# Altium project V3_Board.PrjPcb (part 2 of 9)

## Sheet Regulator_Section.SchDoc
size A4; DocumentNumber: 6; SheetNumber: 6; SheetTotal: 17
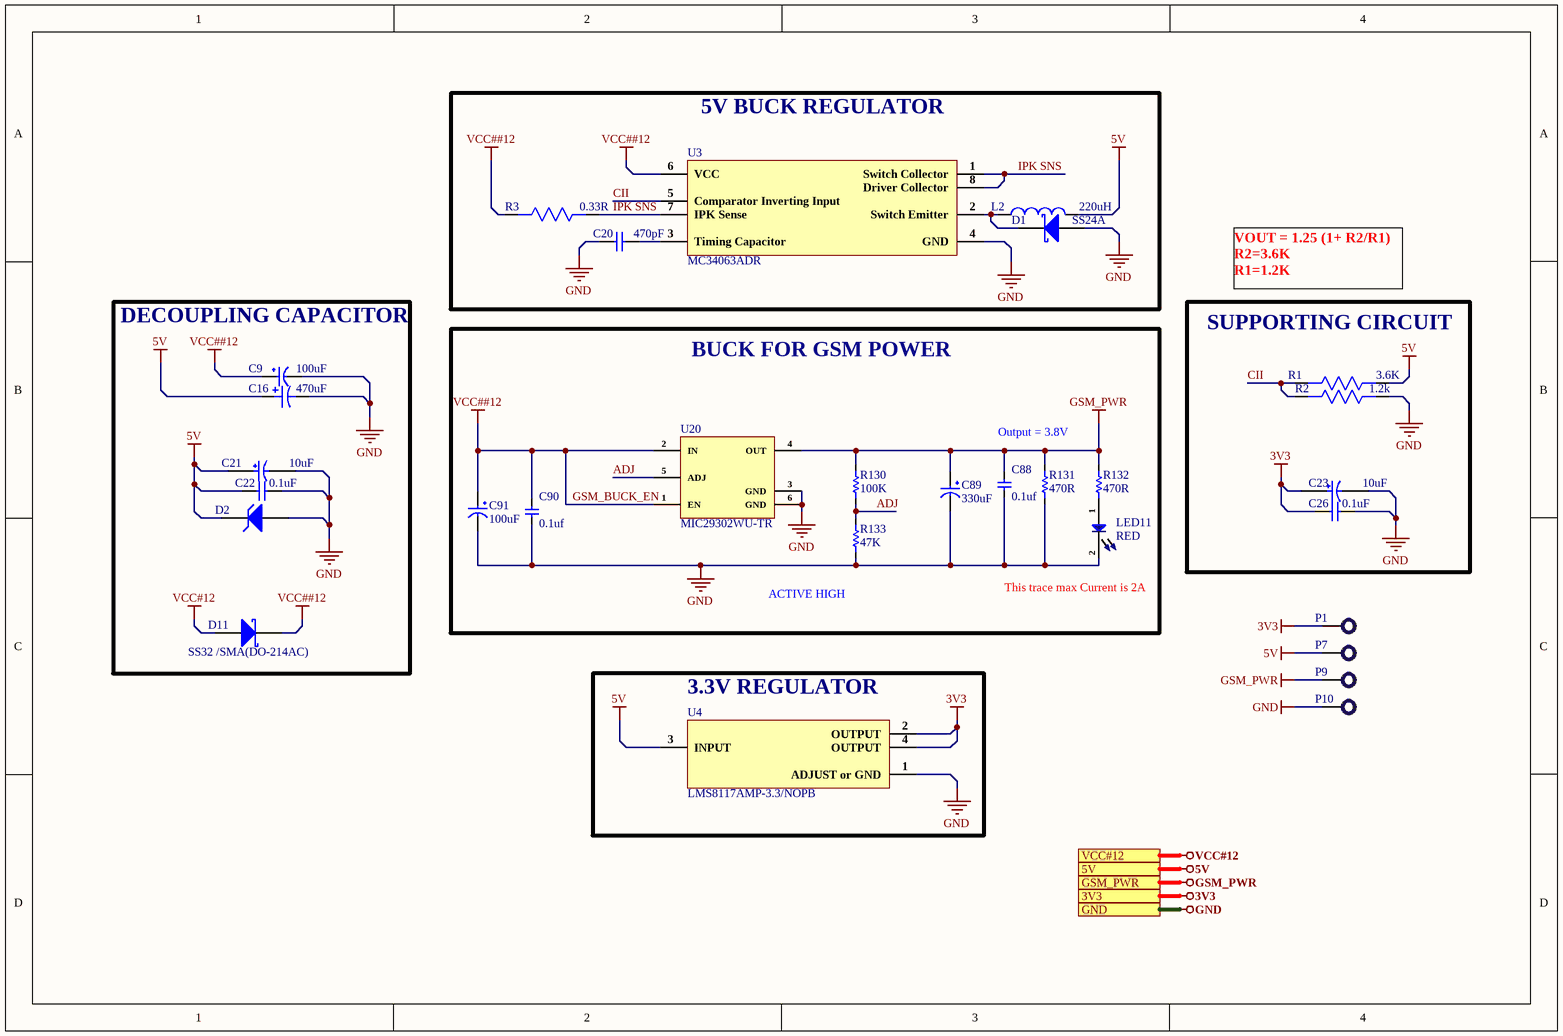
[diagram p4: Regulator_Section.SchDoc]

### Parts
C9  100uF  [UWX1E101MCL1GB]
C16  470uF  [VT1H471MI135000CE0]
C20  470pF  [Cap0603]
C21  10uF  [RVT1E100M0405.]
C22  0.1uF  [Cap0603]
C23  10uF  [RVT1E100M0405.]
C26  0.1uF  [Cap0603]
C88  0.1uf  [Cap-0402]
C89  330uF  [Case-E]
C90  0.1uf  [Cap-0402]
C91  100uF  [Case-B]
D1  SS24A  [SMA]
D2  1SMA5930BT3G  [SMA]  (value not drawn)
D11  SS32 /SMA(DO-214AC)  [SMA]
L2  220uH  [SLF12575T-221M1R3-PF]
LED11  RED  [LED-0603]
P1  Test Point  [TEST POINT]  (value not drawn)
P7  Test Point  [TEST POINT]  (value not drawn)
P9  Test Point  [TEST POINT]  (value not drawn)
P10  Test Point  [TEST POINT]  (value not drawn)
R1  3.6K  [RES-0603]
R2  1.2k  [RES-0603]
R3  0.33R  [RES-0603]
R130  100K  [Res-0201]
R131  470R  [Res-0201]
R132  470R  [Res-0201]
R133  47K  [Res-0402]
U3  MC34063ADR  [SOIC-8]
U4  LMS8117AMP-3.3/NOPB  [SOT-223]
U20  MIC29302WU-TR  [TO-263-5 (D2PAK)]

### Blocks framed on the sheet
5V BUCK REGULATOR: C20 D1 L2 R3 U3
DECOUPLING CAPACITOR: C9 C16 C21 C22 D2 D11
SUPPORTING CIRCUIT: C23 C26 R1 R2
BUCK FOR GSM POWER: C88-C91 LED11 R130-R133 U20
3.3V REGULATOR: U4

### Ports
3V3, 5V, GND, GSM_PWR, VCC#12

### Nets
3V3: C23.1 C26.1 P1.1 U4.2(OUTPUT) U4.4(OUTPUT) ; port 3V3
5V: C16.1 C21.1 C22.1 D2.1(K) L2.2 P7.1 R1.1 U4.3(INPUT) ; port 5V
GND: C9.2 C16.2 C20.1 C21.2 C22.2 C23.2 C26.2 C88.1 C89.2 C90.1 C91.2 D1.2(A) D2.2(A) LED11.2 P10.1 R2.1 R131.1 R133.1 U3.4(GND) U4.1(ADJUST_or_GND) U20.3(GND) U20.6(GND) ; port GND
GSM_BUCK_EN: C9.1 C90.2 C91.1 D11.1(K) R3.2 U3.6(VCC) U20.1(EN) U20.2(IN)  [also labelled VCC##12]
GSM_PWR: C88.2 C89.1 P9.1 R130.2 R131.2 R132.2 U20.4(OUT) ; port GSM_PWR
VCC#12: D11.2(A) ; port VCC#12
ADJ: R130.1 R133.2 U20.5(ADJ)
CII: R1.2 R2.2 U3.5(Comparator_Inverting_Input)
IPK SNS: R3.1 U3.1(Switch_Collector) U3.7(IPK_Sense) U3.8(Driver_Collector)
NetC20_2: C20.2 U3.3(Timing_Capacitor)
NetD1_1: D1.1(K) L2.1 U3.2(Switch_Emitter)
NetLED11_1: LED11.1 R132.1

### Notes on the sheet
- VOUT = 1.25 (1+ R2/R1)
  R2=3.6K
  R1=1.2K
- Output = 3.8V
- (near R133) ACTIVE HIGH
- (near LED11) This trace max Current is 2A

### Library data of the parts
C9 = UWX1E101MCL1GB: CAP ALUM 100UF 20% 25V SMD; Manufacturer: Nichicon; Dielectric Material: Aluminium; Ripple Current: 110mA; Polarity: Polar; Leakage Current: 3uA; Life (Hours): 2000Hour; Dissipation Factor: 0.14%; Lead Diameter: 0.8mm; Supplier 1: Digi-Key; Manufacturer Part Number: UWX1E101MCL1GB; Stock 1: 30613; Pricing 1: 1=0.43, 10=0.301, 50=0.211, 100=0.1808, 500=0.13558 (USD); Mount: Surface Mount; Case/Package: Radial; Number of Pins: 2; Weight: 0.01lb; Min Operating Temperature: -40°C; Max Operating Temperature: 85°C; Capacitance: 100uF; Tolerance: 20%; Ripple Current (AC): 110mA; Voltage Rating: 25V; Packaging: Tape and Reel; Package Quantity: 1000; Voltage Rating (DC): 25V; Termination: SMD/SMT; Voltage: 25V; Series: WX; Construction: Cylindrical; Diameter: 8mm; Length: 5.4mm; Width: 0.25inch; Height: 5.4mm; Lead Pitch: 2.3mm; Height - Seated (Max): 0.213inch; Radiation Hardening: No; REACH SVHC: No SVHC; Lead Free: Lead Free; RoHS Compliant: Yes; ComponentLink1URL: http://nichicon-us.com/english/products/pdfs/e-uwx.pdf?src-supplier=Digi-Key; ComponentLink1Description: http://nichicon-us.com/english/products/pdfs/e-uwx.pdf?src-supplier=Digi-Key; ComponentLink2URL: http://www.nichicon.co.jp/english/products/pdfs/e-ch_ref.pdf?src-supplier=Mouser; ComponentLink2Description: http://www.nichicon.co.jp/english/products/pdfs/e-ch_ref.pdf?src-supplier=Mouser; ComponentLink3URL: http://www.nichicon.co.jp/english/products/pdfs/e-wx.pdf?src-supplier=Avnet; ComponentLink3Description: http://www.nichicon.co.jp/english/products/pdfs/e-wx.pdf?src-supplier=Avnet; ComponentLink4URL: http://uk.rs-online.com/webdocs/0fa3/0900766b80fa3a90.pdf?src-supplier=RSComponents; ComponentLink4Description: http://uk.rs-online.com/webdocs/0fa3/0900766b80fa3a90.pdf?src-supplier=RSComponents; ComponentLink5URL: http://nichicon-us.com/english/products/pdfs/e-wx.pdf?src-supplier=Future+Electronics; ComponentLink5Description: http://nichicon-us.com/english/products/pdfs/e-wx.pdf?src-supplier=Future+Electronics; ComponentLink6URL: http://www.nichicon.co.jp/english/products/pdfs/e-ch_ref.pdf?src-supplier=Avnet+Europe; ComponentLink6Description: http://www.nichicon.co.jp/english/products/pdfs/e-ch_ref.pdf?src-supplier=Avnet+Europe; ComponentLink7URL: http://www.farnell.com/datasheets/2364658.pdf?src-supplier=Element14; ComponentLink7Description: http://www.farnell.com/datasheets/2364658.pdf?src-supplier=Element14; Supplier Part Number 1: 493-2113-6-ND; Supplier 2: Digi-Key; RoHS: Yes; Category: Aluminum Electrolytic Capacitors; Stock 2: 25010; Pricing 2: 1=0.43000, 10=0.30100, 50=0.21100, 100=0.18080, 500=0.13558 (USD); ComponentLink8URL: https://datasheet.ciiva.com/11778/0900766b80fa3a90-11778418.pdf?src-supplier=RSComponents; ComponentLink8Description: https://datasheet.ciiva.com/11778/0900766b80fa3a90-11778418.pdf?src-supplier=RSComponents; ComponentLink9URL: https://datasheet.ciiva.com/17527/e-wx-17527624.pdf?src-supplier=Avnet+Europe; ComponentLink9Description: https://datasheet.ciiva.com/17527/e-wx-17527624.pdf?src-supplier=Avnet+Europe; ComponentLink10URL: https://datasheet.ciiva.com/5361/e-wx-11809-5361100.pdf?src-supplier=Mouser; ComponentLink10Description: https://datasheet.ciiva.com/5361/e-wx-11809-5361100.pdf?src-supplier=Mouser; ComponentLink11URL: https://datasheet.ciiva.com/28458/1912851-28458684.pdf?src-supplier=Element14; ComponentLink11Description: https://datasheet.ciiva.com/28458/1912851-28458684.pdf?src-supplier=Element14; ComponentLink12URL: https://datasheet.ciiva.com/96/e-wx-96650.pdf?src-supplier=Digi-Key; ComponentLink12Description: https://datasheet.ciiva.com/96/e-wx-96650.pdf?src-supplier=Digi-Key; ComponentLink13URL: https://datasheet.ciiva.com/96/e-wx-96651.pdf?src-supplier=Digi-Key; ComponentLink13Description: https://datasheet.ciiva.com/96/e-wx-96651.pdf?src-supplier=Digi-Key; ComponentLink14URL: https://datasheet.ciiva.com/96/e-wx-96652.pdf?src-supplier=Digi-Key; ComponentLink14Description: https://datasheet.ciiva.com/96/e-wx-96652.pdf?src-supplier=Digi-Key; ComponentLink15URL: https://datasheet.ciiva.com/11687/e-wx-11687148.pdf?src-supplier=Avnet; ComponentLink15Description: https://datasheet.ciiva.com/11687/e-wx-11687148.pdf?src-supplier=Avnet; ComponentLink16URL: https://datasheet.ciiva.com/16512/e-wx-16512638.pdf?src-supplier=Future+Electronics; ComponentLink16Description: https://datasheet.ciiva.com/16512/e-wx-16512638.pdf?src-supplier=Future+Electronics; Supplier Part Number 2: 493-2113-1-ND
C16 = VT1H471MI135000CE0: 470uF ±20% 50V 12.5mm 13.5mm 1000hrs 105℃ -40℃~+105℃ SMD,12.5x13.5mm Aluminum Electrolytic Capacitors - SMD RoHS; Manufacturer: Changzhou Huawei Elec; Package: SMD,12.5x13.5mm; Capacitance: 470uF; Tolerance: ±20%; Rated Voltage: 50V; φD: 12.5mm; L: 13.5mm; Lifetime @ Temp: 1000hrs 105℃; Operating Temperature: -40℃~+105℃
C20 = CC0603KRX7R9BB471: CAP CER 470pF 10% X7R 50V 0603 SMD; Manufacturer: Yageo; Dielectric Material: Ceramic; Insulation Resistance: 10GR; Dissipation Factor: 2.5%; Supplier 1: Digi-Key; Manufacturer Part Number: CC0603KRX7R9BB471; RoHS: Yes; Category: Ceramic Capacitors; Stock 1: 2173; Pricing 1: 1=0.10000, 10=0.04500, 50=0.02460, 100=0.02010, 500=0.01432, 1000=0.01125 (USD); Mount: Surface Mount; Case/Package: 0603; Number of Pins: 2; Case Code (Imperial): 0603; Case Code (Metric): 1608; Min Operating Temperature: -55°C; Max Operating Temperature: 125°C; Capacitance: 470pF; Tolerance: 10%; Dielectric: X7R; Series: CC; Voltage Rating: 50V; Voltage Rating (DC): 50V; Packaging: Tape and Reel; Package Quantity: 1; Termination: SMD/SMT; Resistor Type: Ceramic; Length: 1.6mm; Width: 0.8mm; Height: 0.8mm; Depth: 0.8mm; Thickness: 0.035inch; Radiation Hardening: No; RoHS Compliant: Yes; REACH SVHC: No SVHC; Lead Free: Lead Free; Halogen Free: Halogen Free; ComponentLink1URL: https://datasheet.ciiva.com/5425/upy-gphc-x7r-6-3v-to-50v-8-12304-5425461.pdf?src-supplier=Mouser; ComponentLink1Description: https://datasheet.ciiva.com/5425/upy-gphc-x7r-6-3v-to-50v-8-12304-5425461.pdf?src-supplier=Mouser; ComponentLink2URL: https://datasheet.ciiva.com/144/mlccorderingcode-144439.pdf?src-supplier=Digi-Key; ComponentLink2Description: https://datasheet.ciiva.com/144/mlccorderingcode-144439.pdf?src-supplier=Digi-Key; ComponentLink3URL: https://datasheet.ciiva.com/144/mlccorderingcode-144440.pdf?src-supplier=Digi-Key; ComponentLink3Description: https://datasheet.ciiva.com/144/mlccorderingcode-144440.pdf?src-supplier=Digi-Key; ComponentLink4URL: https://datasheet.ciiva.com/11587/upy-gphc-x7r-6-3v-to-50v-8-11587224.pdf?src-supplier=Avnet; ComponentLink4Description: https://datasheet.ciiva.com/11587/upy-gphc-x7r-6-3v-to-50v-8-11587224.pdf?src-supplier=Avnet; ComponentLink5URL: https://datasheet.ciiva.com/144/mlccorderingcode-144441.pdf?src-supplier=Digi-Key; ComponentLink5Description: https://datasheet.ciiva.com/144/mlccorderingcode-144441.pdf?src-supplier=Digi-Key; ComponentLink6URL: https://datasheet.ciiva.com/16623/upy-gphc-x7r-6-3v-to-50v-8-16623897.pdf?src-supplier=Avnet+Europe; ComponentLink6Description: https://datasheet.ciiva.com/16623/upy-gphc-x7r-6-3v-to-50v-8-16623897.pdf?src-supplier=Avnet+Europe; ComponentLink7URL: https://datasheet.ciiva.com/8033/1489800-8033898.pdf?src-supplier=Element14; ComponentLink7Description: https://datasheet.ciiva.com/8033/1489800-8033898.pdf?src-supplier=Element14; ComponentLink8URL: https://datasheet.ciiva.com/8033/1489800-8033899.pdf?src-supplier=Element14; ComponentLink8Description: https://datasheet.ciiva.com/8033/1489800-8033899.pdf?src-supplier=Element14; ComponentLink9URL: https://datasheet.ciiva.com/26829/getdatasheetpartid-251791-26829452.pdf?src-supplier=Verical; ComponentLink9Description: https://datasheet.ciiva.com/26829/getdatasheetpartid-251791-26829452.pdf?src-supplier=Verical; ComponentLink10URL: https://datasheet.ciiva.com/28450/1489800-28450652.pdf?src-supplier=Element14; ComponentLink10Description: https://datasheet.ciiva.com/28450/1489800-28450652.pdf?src-supplier=Element14; ComponentLink11URL: https://datasheet.ciiva.com/8033/70765-8033902.pdf?src-supplier=Element14; ComponentLink11Description: https://datasheet.ciiva.com/8033/70765-8033902.pdf?src-supplier=Element14; Supplier Part Number 1: 311-1078-1-ND
C21 C23 = RVT1E100M0405: CAP ALUM 10uF 25V SMD; Manufacturer: ROQANG; φD: 4mm; L: 5.4mm; Tolerance: ±20%; Operating Temperature: -45℃~+105℃; Rated Voltage: 25V; Capacitance: 10uF
C22 C26 = CC0603ZRY5V9BB104: CAP CER 0.1UF 50V Y5V 0603; Manufacturer: Yageo; Capacitance: 100nF; Tolerance: 80%; Supplier 1: Digi-Key; Manufacturer Part Number: CC0603ZRY5V9BB104; Stock 1: 15000880; Pricing 1: 1=0.1, 10=0.075, 100=0.0334, 500=0.02386, 1000=0.01874 (USD); Mount: Surface Mount; Case/Package: 0603; Number of Pins: 2; Case Code (Metric): 1608; Case Code (Imperial): 0603; Min Operating Temperature: -30°C; Max Operating Temperature: 85°C; Dielectric: Y5V; Voltage Rating: 50V; Package Quantity: 1; Packaging: Tape and Reel; Voltage Rating (DC): 50V; Termination: SMD/SMT; Composition: Ceramic; Voltage: 50V; Length: 1.6mm; Height: 0.8mm; Width: 0.031inch; Thickness: 0.035inch; Depth: 0.8mm; Radiation Hardening: No; REACH SVHC: No SVHC; Lead Free: Lead Free; Halogen Free: Halogen Free; ComponentLink1URL: http://www.yageo.com/documents/recent/UPY-GPHC_Y5V_6.3V-to-50V_8.pdf?src-supplier=Digi-Key; ComponentLink1Description: http://www.yageo.com/documents/recent/UPY-GPHC_Y5V_6.3V-to-50V_8.pdf?src-supplier=Digi-Key; ComponentLink2URL: http://www.yageo.com/documents/recent/UPY-GPHC_Y5V_6.3V-to-50V_5.pdf?src-supplier=Avnet+Europe; ComponentLink2Description: http://www.yageo.com/documents/recent/UPY-GPHC_Y5V_6.3V-to-50V_5.pdf?src-supplier=Avnet+Europe; ComponentLink3URL: https://www.verical.com/server-webapp/html/getDatasheet?partID=403611&src-supplier=Verical; ComponentLink3Description: https://www.verical.com/server-webapp/html/getDatasheet?partID=403611&src-supplier=Verical; ComponentLink4URL: http://www.mouser.com/ds/2/447/Yageo_UPY-GP_NP0_16V-to-50V_9-358835.pdf?src-supplier=Mouser; ComponentLink4Description: http://www.mouser.com/ds/2/447/Yageo_UPY-GP_NP0_16V-to-50V_9-358835.pdf?src-supplier=Mouser; ComponentLink5URL: http://www.farnell.com/datasheets/1132289.pdf?src-supplier=Element14; ComponentLink5Description: http://www.farnell.com/datasheets/1132289.pdf?src-supplier=Element14; Supplier Part Number 1: 311-1343-1-ND
C88 C90 = GRM155R62A104KE14D: CAP CER 0.1UF 100V X5R 0402; Manufacturer: Murata; Capacitance: 100nF; Tolerance: 10%; Item Type: Capacitor; Supplier 1: Arrow Electronics; Manufacturer Part Number: GRM155R62A104KE14D; RoHS: Yes; Category: Ceramic Capacitors; Stock 1: 870000; Pricing 1: 10000=0.00500, 20000=0.00410, 30000=0.00390, 50000=0.00370, 100000=0.00300 (USD); Mount: Surface Mount; Case/Package: 0402; Case Code (Metric): 1005; Case Code (Imperial): 0402; Weight: 0.000212oz; Min Operating Temperature: -55°C; Max Operating Temperature: 85°C; Packaging: Tape and Reel; Voltage Rating: 100V; Dielectric: X5R; Termination: SMD/SMT; Voltage Rating (DC): 100V; Package Quantity: 10000; Series: GRM; Length: 0.039inch; Width: 0.02inch; Height: 0.5mm; Thickness: 0.022inch; Reach SVHC Compliant: Yes; Lead Free: Lead Free; RoHS Compliant: Yes; ComponentLink1URL: http://www.farnell.com/datasheets/2079151.pdf?src-supplier=Farnell; ComponentLink1Description: http://www.farnell.com/datasheets/2079151.pdf?src-supplier=Farnell; ComponentLink2URL: http://www.mouser.com/ds/2/281/c02e-2905.pdf?src-supplier=Mouser; ComponentLink2Description: http://www.mouser.com/ds/2/281/c02e-2905.pdf?src-supplier=Mouser; ComponentLink3URL: http://www.farnell.com/datasheets/2079151.pdf?src-supplier=Element14; ComponentLink3Description: http://www.farnell.com/datasheets/2079151.pdf?src-supplier=Element14; ComponentLink4URL: http://search.murata.co.jp/Ceramy/image/img/A01X/G101/ENG/GRM155R62A104KE14-01.pdf?src-supplier=Digi-Key; ComponentLink4Description: http://search.murata.co.jp/Ceramy/image/img/A01X/G101/ENG/GRM155R62A104KE14-01.pdf?src-supplier=Digi-Key; ComponentLink5URL: http://www.farnell.com/datasheets/2079151.pdf?src-supplier=Newark; ComponentLink5Description: http://www.farnell.com/datasheets/2079151.pdf?src-supplier=Newark; Supplier Part Number 1: GRM155R62A104KE14D; LCSC Part Number: C162178
C89 = TAJE337M016RNJ: CAP TANT 330UF 20% 16V 2917; Manufacturer: Kyocera AVX; ESR (Equivalent Series Resistance): 400mR; Leakage Current: 52.8uA; Dissipation Factor: 30%; Item Type: Capacitor; Supplier 1: Arrow Electronics; Manufacturer Part Number: TAJE337M016RNJ; RoHS: Yes; Category: Tantalum Capacitors; Stock 1: 4000; Pricing 1: 400=1.8678, 2000=1.7998, 4000=1.7657, 6000=1.7481, 10000=1.7306, 30000=1.7133, 50000=1.6961 (USD); Mounting Technology: Surface Mount; Case/Package: 2917; Case Code (Imperial): 2917; Case Code (Metric): 7343; Min Operating Temperature: -55°C; Max Operating Temperature: 125°C; Voltage Rating: 16V; Tolerance: 20%; Packaging: Tape and Reel; Value: 330uF; Termination: SMD/SMT; Voltage Rating (DC): 16V; Series: TAJ; Features: General Purpose; Length: 7.3mm; Width: 4.3mm; Height: 4.3mm; Lead Free: Lead Free; RoHS Compliant: Yes; ComponentLink1URL: https://datasheet.ciiva.com/12882/taj-27497-12882412.pdf?src-supplier=Mouser; ComponentLink1Description: https://datasheet.ciiva.com/12882/taj-27497-12882412.pdf?src-supplier=Mouser; Supplier Part Number 1: TAJE337M016RNJ; LCSC Part Number: C51599
C91 = TAJB107M010RNJ: CAP TANT 100UF 20% 10V 1411; Manufacturer: Kyocera AVX; Dielectric Material: Tantalum; Tolerance: 10%; ESR (Equivalent Series Resistance): 1.4R; Leakage Current: 10uA; Dissipation Factor: 8%; Item Type: Capacitor; Supplier 1: Rs; Manufacturer Part Number: TAJB107M010RNJ; RoHS: Yes; Category: Tantalum Capacitors; Stock 1: 17520; Pricing 1: 2000=0.302 (GBP); Mounting Technology: Surface Mount; Case/Package: 1210; Case Code (Imperial): 1210; Case Code (Metric): 3528; Min Operating Temperature: -55°C; Max Operating Temperature: 125°C; Value: 100uF; Voltage Rating (DC): 10V; Series: TAJ; Construction: Flat; Voltage Rating: 10V; Package Quantity: 2000; Packaging: Tape and Reel; Termination: SMD/SMT; Voltage: 10V; Features: General Purpose; Length: 3.5mm; Width: 2.8mm; Height: 2.1mm; Depth: 2.8mm; Radiation Hardening: No; Lead Free: Lead Free; RoHS Compliant: Yes; Reach SVHC Compliant: No; ComponentLink1URL: https://datasheet.ciiva.com/264/taj-264281.pdf?src-supplier=Digi-Key; ComponentLink1Description: https://datasheet.ciiva.com/264/taj-264281.pdf?src-supplier=Digi-Key; ComponentLink2URL: https://datasheet.ciiva.com/264/taj-264280.pdf?src-supplier=Digi-Key; ComponentLink2Description: https://datasheet.ciiva.com/264/taj-264280.pdf?src-supplier=Digi-Key; ComponentLink3URL: https://datasheet.ciiva.com/264/taj-264282.pdf?src-supplier=Digi-Key; ComponentLink3Description: https://datasheet.ciiva.com/264/taj-264282.pdf?src-supplier=Digi-Key; ComponentLink4URL: https://datasheet.ciiva.com/11225/taj-11225964.pdf?src-supplier=Avnet; ComponentLink4Description: https://datasheet.ciiva.com/11225/taj-11225964.pdf?src-supplier=Avnet; ComponentLink5URL: https://datasheet.ciiva.com/11225/taj-11225963.pdf?src-supplier=Avnet; ComponentLink5Description: https://datasheet.ciiva.com/11225/taj-11225963.pdf?src-supplier=Avnet; Supplier Part Number 1: 1354069; LCSC Part Number: C7196
D1 = SS24A: 40V 500mV@2A 2A SMA(DO-214AC) Schottky Barrier Diodes (SBD) ROHS; Manufacturer: Yangzhou; Manufacturer Part Number: SS24A; Footprint: SMA(DO-214AC); ComponentLink1Description: LCSC; ComponentLink1URL: https://lcsc.com/product-detail/Schottky-Barrier-Diodes-SBD_Yangzhou-Yangjie-Elec-Tech-SS24A_C211773.html
D2 = 1SMA5930BT3G: DIODE ZENER 16V 1.5W SMA; Manufacturer: ON Semiconductor; Tolerance: 5%; Max Reverse Leakage Current: 500nA; Impedance: 10R; Element Configuration: Single; Forward Voltage: 1.5V; Power Dissipation: 500mW; Zener Current: 94mA; Test Current: 23.4mA; ESD Protection: Yes; Supplier 1: Avnet; Manufacturer Part Number: 1SMA5930BT3G; RoHS: Yes; Category: Zener Diodes; Stock 1: 52; Pricing 1: 5000=0.16900 (USD); Case/Package: SMA; Number of Pins: 2; Contact Plating: Tin,Matte; Min Operating Temperature: -65°C; Max Operating Temperature: 150°C; Packaging: Tape and Reel; Package Quantity: 1; Max Power Dissipation: 1.5W; Voltage Tolerance: 5%; Zener Voltage: 16V; Working Voltage: 16V; Max Reverse Current: 500nA; Power Rating: 1.5W; Voltage Rating (DC): 16V; Length: 4.57mm; Width: 2.92mm; Height: 2.05mm; Radiation Hardening: No; Lead Free: Lead Free; Halogen Free: Halogen Free; RoHS Compliant: Yes; REACH SVHC: No SVHC; ComponentLink1URL: https://datasheet.ciiva.com/15142/getdatasheetpartid-39534-15142033.pdf?src-supplier=Verical; ComponentLink1Description: https://datasheet.ciiva.com/15142/getdatasheetpartid-39534-15142033.pdf?src-supplier=Verical; ComponentLink2URL: https://datasheet.ciiva.com/30478/0900766b8127698c-30478429.pdf?src-supplier=RSComponents; ComponentLink2Description: https://datasheet.ciiva.com/30478/0900766b8127698c-30478429.pdf?src-supplier=RSComponents; ComponentLink3URL: https://datasheet.ciiva.com/8026/1sma5913bt3-d-8026927.pdf?src-supplier=Element14; ComponentLink3Description: https://datasheet.ciiva.com/8026/1sma5913bt3-d-8026927.pdf?src-supplier=Element14; ComponentLink4URL: https://datasheet.ciiva.com/26092/1sma5913bt3-d-26092437.pdf?src-supplier=Avnet+Europe; ComponentLink4Description: https://datasheet.ciiva.com/26092/1sma5913bt3-d-26092437.pdf?src-supplier=Avnet+Europe; ComponentLink5URL: https://datasheet.ciiva.com/895/1sma5913bt3-d-895337.pdf?src-supplier=Digi-Key; ComponentLink5Description: https://datasheet.ciiva.com/895/1sma5913bt3-d-895337.pdf?src-supplier=Digi-Key; ComponentLink6URL: https://datasheet.ciiva.com/895/1sma5913bt3-d-895338.pdf?src-supplier=Digi-Key; ComponentLink6Description: https://datasheet.ciiva.com/895/1sma5913bt3-d-895338.pdf?src-supplier=Digi-Key; ComponentLink7URL: https://datasheet.ciiva.com/895/1sma5913bt3-d-895336.pdf?src-supplier=Digi-Key; ComponentLink7Description: https://datasheet.ciiva.com/895/1sma5913bt3-d-895336.pdf?src-supplier=Digi-Key; ComponentLink8URL: https://datasheet.ciiva.com/49028/70339291-49028059.pdf?src-supplier=Allied+Electronics; ComponentLink8Description: https://datasheet.ciiva.com/49028/70339291-49028059.pdf?src-supplier=Allied+Electronics; Supplier Part Number 1: 26K5257
D11 = SS32 /SMA(DO-214AC): 20V 500mV@3A 3A SMA(DO-214AC) Schottky Barrier Diodes (SBD) ROHS; Manufacturer: MDD; Item Type: Diode; Manufacturer Part Number: SS32; Package: SMA(DO-214AC); LCSC Part Number: C34897; ComponentLink1Description: LCSC; ComponentLink1URL: https://www.lcsc.com/product-detail/Schottky-Barrier-Diodes-SBD_MDD-Microdiode-Electronics-SS32_C34897.html
L2 = SLF12575T-221M1R3-PF: Inductor Power Shielded Wirewound 220uH 20% 1KHz Ferrite 1.3A 310mOhm DCR Blister T/R; Manufacturer: TDK; DC Resistance (DCR): 310mR; Supplier 1: Digi-Key; Manufacturer Part Number: SLF12575T-221M1R3-PF; RoHS: Yes; Category: Fixed Inductors; Stock 1: 1079; Pricing 1: 1=1.97000, 10=1.81500, 25=1.66360, 50=1.42180, 100=1.27050, 250=1.08900 (USD); Mount: Surface Mount; Case/Package: Nonstandard; Core Material: Ferrite; Min Operating Temperature: -20°C; Max Operating Temperature: 105°C; Package Quantity: 500; Packaging: Tape and Reel; Tolerance: 20%; Shielding: Shielded; Inductance: 220uH; Current Rating: 1.3A; Saturation Current: 1.3A; Max DC Current: 1.3A; Termination: SMD/SMT; Resistor Type: Wirewound; Test Frequency: 1kHz; DC Current: 1.3A; Series: SLF; Length: 12.5mm; Width: 12.5mm; Height: 0.295inch; Height - Seated (Max): 0.309inch; Depth: 12.8mm; Military Standard: Not; Lead Free: Lead Free; RoHS Compliant: Yes; ComponentLink1URL: https://datasheet.ciiva.com/11802/0900766b812b7d4f-11802208.pdf?src-supplier=RSComponents; ComponentLink1Description: https://datasheet.ciiva.com/11802/0900766b812b7d4f-11802208.pdf?src-supplier=RSComponents; Supplier Part Number 1: 445-174412-1-ND
LED11 = 19-21/R7C-AK1L2BY/3T: Red 632nm LED Indication - Discrete 2.05V 0603 (1608 Metric); Manufacturer: Everlight Elec; Manufacturer Part Number: 19-21/R7C-AK1L2BY/3T; Package: 0603; LCSC Part Number: C1322287; Item Type: LED; ComponentLink1Description: LCSC; ComponentLink1URL: https://www.lcsc.com/product-detail/Light-Emitting-Diodes-LED_Everlight-Elec-19-21-R7C-AK1L2BY-3T_C1322287.html
P1 P7 P9 P10 = TEST POINT: Test Point ON
R1 = AC0603FR-073K6L: Res Thick Film 0603 3.6K Ohm 1% 1/10W ±100ppm/°C Molded SMD Paper T/R; Manufacturer: Yageo; Voltage Rating: 50V; Power Rating: 100mW; Resistance: 3.6kR; Supplier 1: Arrow Electronics; Manufacturer Part Number: AC0603FR-073K6L; RoHS: Yes; Category: Chip SMD Resistors; Stock 1: 20000; Pricing 1: 5000=0.00370, 10000=0.00290 (USD); Case/Package: 0603; Case Code (Imperial): 0603; Case Code (Metric): 1608; Weight: 7.1E-05oz; Min Operating Temperature: -55°C; Max Operating Temperature: 155°C; Packaging: Tape and Reel; Tolerance: 1%; Resistor Type: Thick Film; Termination: SMD/SMT; Number of Terminations: 2; Temperature Coefficient: 100ppm/°C; Max Power Dissipation: 100mW; Features: Moisture Resistant,Automotive AEC-Q200; Series: AC; Construction: Rectangular; Length: 1.6mm; Width: 0.8mm; Height: 0.022inch; Depth: 0.8mm; Military Standard: Not; RoHS Compliant: Yes; ComponentLink1URL: http://www.mouser.com/ds/2/447/yageodocoutput-1111992.pdf?src-supplier=Mouser; ComponentLink1Description: http://www.mouser.com/ds/2/447/yageodocoutput-1111992.pdf?src-supplier=Mouser; ComponentLink2URL: http://www.yageo.com/NewPortal/yageodocoutput?fileName=/pdf/R-Chip/PYu-AC_51_RoHS_L_6.pdf&src-supplier=Digi-Key; ComponentLink2Description: http://www.yageo.com/NewPortal/yageodocoutput?fileName=/pdf/R-Chip/PYu-AC_51_RoHS_L_6.pdf&src-supplier=Digi-Key; Supplier Part Number 1: AC0603FR-073K6L
R2 = RC0603FR-071K2L: RES 1.2K OHM 1% 1/10W 0603; Manufacturer: Yageo; Power Rating: 100mW; Voltage Rating (DC): 50V; Resistance: 1.2kR; Temperature Coefficient: 100ppm/°C; Supplier 1: Arrow Electronics; Manufacturer Part Number: RC0603FR-071K2L; RoHS: Yes; Category: Chip SMD Resistors; Stock 1: 85000; Pricing 1: 5000=0.00310 (USD); Case/Package: 0603; Number of Pins: 2; Case Code (Imperial): 0603; Case Code (Metric): 1608; Size Code: 0603; Min Operating Temperature: -55°C; Max Operating Temperature: 155°C; Tolerance: 1%; Packaging: Tape and Reel; Voltage Rating: 50V; Termination: SMD/SMT; Resistor Type: Thick Film; Features: Moisture Resistant; Series: RC; Max Power Dissipation: 100mW; Number of Terminations: 2; Construction: Rectangular; Resistance Tolerance: 1%; Length: 1.6mm; Width: 0.8mm; Height: 0.45mm; Depth: 0.8mm; REACH SVHC: No SVHC; Lead Free: Lead Free; Military Standard: Not; RoHS Compliant: Yes; ComponentLink1URL: http://www.farnell.com/datasheets/2167052.pdf?src-supplier=Farnell; ComponentLink1Description: http://www.farnell.com/datasheets/2167052.pdf?src-supplier=Farnell; ComponentLink2URL: http://www.farnell.com/datasheets/1868787.pdf?src-supplier=Farnell; ComponentLink2Description: http://www.farnell.com/datasheets/1868787.pdf?src-supplier=Farnell; ComponentLink3URL: http://www.farnell.com/datasheets/443971.pdf?src-supplier=Farnell; ComponentLink3Description: http://www.farnell.com/datasheets/443971.pdf?src-supplier=Farnell; ComponentLink4URL: http://www.mouser.com/ds/2/447/RC0603-272842.pdf?src-supplier=Mouser; ComponentLink4Description: http://www.mouser.com/ds/2/447/RC0603-272842.pdf?src-supplier=Mouser; ComponentLink5URL: http://www.farnell.com/datasheets/2167052.pdf?src-supplier=Newark; ComponentLink5Description: http://www.farnell.com/datasheets/2167052.pdf?src-supplier=Newark; ComponentLink6URL: http://www.farnell.com/datasheets/2167052.pdf?src-supplier=Element14; ComponentLink6Description: http://www.farnell.com/datasheets/2167052.pdf?src-supplier=Element14; ComponentLink7URL: http://www.farnell.com/datasheets/1868787.pdf?src-supplier=Newark; ComponentLink7Description: http://www.farnell.com/datasheets/1868787.pdf?src-supplier=Newark; ComponentLink8URL: http://www.yageo.com/documents/recent/PYu-RC_Group_51_RoHS_L_9.pdf?src-supplier=Digi-Key; ComponentLink8Description: http://www.yageo.com/documents/recent/PYu-RC_Group_51_RoHS_L_9.pdf?src-supplier=Digi-Key; ComponentLink9URL: http://www.yageo.com/documents/recent/PYu-RC0603_51_RoHS_L_7.pdf?src-supplier=Future+Electronics; ComponentLink9Description: http://www.yageo.com/documents/recent/PYu-RC0603_51_RoHS_L_7.pdf?src-supplier=Future+Electronics; ComponentLink10URL: http://www.yageo.com/documents/recent/PYu-RC_Group_51_RoHS_L_10.pdf?src-supplier=Digi-Key; ComponentLink10Description: http://www.yageo.com/documents/recent/PYu-RC_Group_51_RoHS_L_10.pdf?src-supplier=Digi-Key; ComponentLink11URL: http://www.farnell.com/datasheets/1868787.pdf?src-supplier=Element14; ComponentLink11Description: http://www.farnell.com/datasheets/1868787.pdf?src-supplier=Element14; ComponentLink12URL: http://www.farnell.com/datasheets/443971.pdf?src-supplier=Element14; ComponentLink12Description: http://www.farnell.com/datasheets/443971.pdf?src-supplier=Element14; ComponentLink13URL: https://www.verical.com/server-webapp/html/getDatasheet?partID=326670&src-supplier=Verical; ComponentLink13Description: https://www.verical.com/server-webapp/html/getDatasheet?partID=326670&src-supplier=Verical; Supplier Part Number 1: RC0603FR-071K2L
R3 = RTT03R330FTP: ±1% 1/10W Thick Film Resistors 75V ±600ppm/℃ -55℃~+155℃ 0.33Ω 0603 Chip Resistor - Surface Mount ROHS; Manufacturer: RALEC; Manufacturer Part No: RTT03R330FTP; Value: 0.33Ω; Package: 0603
R130 = RC0201JR-07100KL: RES SMD 100K OHM 5% 1/20W 0201; Manufacturer: Yageo; Resistance: 100kR; Temperature Coefficient: 200ppm/°C; Power Rating: 50mW; Voltage Rating: 25V; Supplier 1: Arrow Electronics; Manufacturer Part Number: RC0201JR-07100KL; RoHS: Yes; Category: Chip SMD Resistors; Stock 1: 76; Pricing 1: 1=0.09240, 10=0.09140, 25=0.05450, 10000=0.00340, 100000=0.00320, 1000000=0.00180, 5000000=0.00110 (USD); Case/Package: 0201; Contact Plating: Tin,Matte; Case Code (Metric): 0603; Case Code (Imperial): 0201; Weight: 6E-06oz; Size Code: 0201; Min Operating Temperature: -55°C; Max Operating Temperature: 125°C; Tolerance: 5%; Resistor Type: Thick Film; Package Quantity: 1; Packaging: Tape and Reel; Number of Terminations: 2; Termination: SMD/SMT; Max Power Dissipation: 50mW; Voltage Rating (DC): 25V; Features: Moisture Resistant; Series: RC; Resistance Tolerance: 5%; Construction: Rectangular; Length: 0.6mm; Width: 0.012inch; Height: 0.01inch; Depth: 0.3mm; Radiation Hardening: No; REACH SVHC: No SVHC; Military Standard: Not; Lead Free: Lead Free; RoHS Compliant: Yes; ComponentLink1URL: https://datasheet.ciiva.com/2462/pyu-r-int-thick-7-2462817.pdf?src-supplier=Digi-Key; ComponentLink1Description: https://datasheet.ciiva.com/2462/pyu-r-int-thick-7-2462817.pdf?src-supplier=Digi-Key; ComponentLink2URL: https://datasheet.ciiva.com/2462/pyu-r-int-thick-7-2462818.pdf?src-supplier=Digi-Key; ComponentLink2Description: https://datasheet.ciiva.com/2462/pyu-r-int-thick-7-2462818.pdf?src-supplier=Digi-Key; ComponentLink3URL: https://datasheet.ciiva.com/2462/pyu-r-int-thick-7-2462819.pdf?src-supplier=Digi-Key; ComponentLink3Description: https://datasheet.ciiva.com/2462/pyu-r-int-thick-7-2462819.pdf?src-supplier=Digi-Key; ComponentLink4URL: https://datasheet.ciiva.com/8888/pyu-rc0201-51-rohs-l-8-8888005.pdf?src-supplier=Avnet; ComponentLink4Description: https://datasheet.ciiva.com/8888/pyu-rc0201-51-rohs-l-8-8888005.pdf?src-supplier=Avnet; ComponentLink5URL: https://datasheet.ciiva.com/8896/pyu-rc0201-51-rohs-l-8-8896213.pdf?src-supplier=Avnet; ComponentLink5Description: https://datasheet.ciiva.com/8896/pyu-rc0201-51-rohs-l-8-8896213.pdf?src-supplier=Avnet; ComponentLink6URL: https://datasheet.ciiva.com/28395/pyu-rc0201-51-rohs-l-8-28395542.pdf?src-supplier=Avnet+Europe; ComponentLink6Description: https://datasheet.ciiva.com/28395/pyu-rc0201-51-rohs-l-8-28395542.pdf?src-supplier=Avnet+Europe; ComponentLink7URL: https://datasheet.ciiva.com/28639/1421516-28639863.pdf?src-supplier=Element14; ComponentLink7Description: https://datasheet.ciiva.com/28639/1421516-28639863.pdf?src-supplier=Element14; ComponentLink8URL: https://datasheet.ciiva.com/7672/1563626-7672249.pdf?src-supplier=Element14; ComponentLink8Description: https://datasheet.ciiva.com/7672/1563626-7672249.pdf?src-supplier=Element14; ComponentLink9URL: https://datasheet.ciiva.com/7672/1563626-7672250.pdf?src-supplier=Element14; ComponentLink9Description: https://datasheet.ciiva.com/7672/1563626-7672250.pdf?src-supplier=Element14; Supplier Part Number 1: RC0201JR-07100KL; LCSC Part Number: C106230
R131 R132 = RC0201JR-07470RL: RES 470 OHM 5% 1/20W 0201; Manufacturer: Yageo; Temperature Coefficient: 200ppm/°C; Voltage Rating (DC): 25V; Max Power Dissipation: 50mW; Supplier 1: Digi-Key; Manufacturer Part Number: RC0201JR-07470RL; RoHS: Yes; Category: Chip SMD Resistors; Stock 1: 173754; Pricing 1: 1=0.10000, 10=0.02600, 100=0.01040, 1000=0.00466, 2500=0.00405, 5000=0.00334 (USD); Case/Package: 0201; Number of Pins: 2; Contact Plating: Tin,Matte; Case Code (Metric): 0603; Case Code (Imperial): 0201; Min Operating Temperature: -55°C; Max Operating Temperature: 125°C; Resistor Type: Thick Film; Tolerance: 5%; Resistance: 470R; Number of Terminations: 2; Termination: SMD/SMT; Features: Moisture Resistant; Power Rating: 50mW; Voltage Rating: 25V; Package Quantity: 1; Packaging: Tape and Reel; Length: 0.6mm; Width: 0.3mm; Height: 0.01inch; Depth: 0.3mm; Radiation Hardening: No; Military Standard: Not; Lead Free: Lead Free; REACH SVHC: No SVHC; ComponentLink1URL: https://datasheet.ciiva.com/5924/443682-5924928.pdf?src-supplier=Farnell; ComponentLink1Description: https://datasheet.ciiva.com/5924/443682-5924928.pdf?src-supplier=Farnell; ComponentLink2URL: https://datasheet.ciiva.com/8885/pyu-rc0201-51-rohs-l-8-8885600.pdf?src-supplier=Avnet; ComponentLink2Description: https://datasheet.ciiva.com/8885/pyu-rc0201-51-rohs-l-8-8885600.pdf?src-supplier=Avnet; ComponentLink3URL: https://datasheet.ciiva.com/28390/pyu-rc0201-51-rohs-l-8-28390376.pdf?src-supplier=Avnet+Europe; ComponentLink3Description: https://datasheet.ciiva.com/28390/pyu-rc0201-51-rohs-l-8-28390376.pdf?src-supplier=Avnet+Europe; ComponentLink4URL: https://datasheet.ciiva.com/8885/pyu-rc0201-51-rohs-l-8-8885642.pdf?src-supplier=Avnet; ComponentLink4Description: https://datasheet.ciiva.com/8885/pyu-rc0201-51-rohs-l-8-8885642.pdf?src-supplier=Avnet; ComponentLink5URL: https://datasheet.ciiva.com/2462/pyu-r-int-thick-7-2462802.pdf?src-supplier=Digi-Key; ComponentLink5Description: https://datasheet.ciiva.com/2462/pyu-r-int-thick-7-2462802.pdf?src-supplier=Digi-Key; ComponentLink6URL: https://datasheet.ciiva.com/2462/pyu-r-int-thick-7-2462803.pdf?src-supplier=Digi-Key; ComponentLink6Description: https://datasheet.ciiva.com/2462/pyu-r-int-thick-7-2462803.pdf?src-supplier=Digi-Key; ComponentLink7URL: https://datasheet.ciiva.com/2462/pyu-r-int-thick-7-2462804.pdf?src-supplier=Digi-Key; ComponentLink7Description: https://datasheet.ciiva.com/2462/pyu-r-int-thick-7-2462804.pdf?src-supplier=Digi-Key; Supplier Part Number 1: 311-470NCT-ND; LCSC Part Number: C163491
R133 = RC0402FR-0747KL: RES 47K OHM 1% 1/16W 0402; Manufacturer: Yageo; Power Rating: 62.5mW; Temperature Coefficient: 100ppm/°C; Voltage Rating: 50V; Resistance: 47kR; Max Power Dissipation: 63mW; Item Type: Resistor; Supplier 1: Avnet; Manufacturer Part Number: RC0402FR-0747KL; RoHS: Yes; Category: Chip SMD Resistors; Stock 1: 680000; Pricing 1: 10000=0.00085, 20000=0.00087, 40000=0.00084, 60000=0.00083, 80000=0.00079, 100000=0.00078, 1000000=0.00076 (USD); Case/Package: 0402; Case Code (Imperial): 0402; Case Code (Metric): 1005; Size Code: 0402; Min Operating Temperature: -55°C; Max Operating Temperature: 155°C; Tolerance: 1%; Series: RC; Packaging: Tape and Reel; Package Quantity: 1; Termination: SMD/SMT; Resistor Type: Thick Film; Number of Terminations: 2; Features: Moisture Resistant; Resistance Tolerance: 1%; Construction: Rectangular; Length: 1mm; Width: 0.02inch; Height: 0.016inch; Depth: 0.5mm; RoHS Compliant: Yes; Military Standard: Not; Lead Free: Lead Free; ComponentLink1URL: https://datasheet.ciiva.com/46412/1018594-46412839.pdf?src-supplier=Element14; ComponentLink1Description: https://datasheet.ciiva.com/46412/1018594-46412839.pdf?src-supplier=Element14; ComponentLink2URL: https://datasheet.ciiva.com/2453/pyu-r-int-thick-7-2453389.pdf?src-supplier=Digi-Key; ComponentLink2Description: https://datasheet.ciiva.com/2453/pyu-r-int-thick-7-2453389.pdf?src-supplier=Digi-Key; ComponentLink3URL: https://datasheet.ciiva.com/2453/pyu-r-int-thick-7-2453390.pdf?src-supplier=Digi-Key; ComponentLink3Description: https://datasheet.ciiva.com/2453/pyu-r-int-thick-7-2453390.pdf?src-supplier=Digi-Key; ComponentLink4URL: https://datasheet.ciiva.com/2453/pyu-r-int-thick-7-2453388.pdf?src-supplier=Digi-Key; ComponentLink4Description: https://datasheet.ciiva.com/2453/pyu-r-int-thick-7-2453388.pdf?src-supplier=Digi-Key; ComponentLink5URL: https://datasheet.ciiva.com/15189/getdatasheetpartid-323748-15189466.pdf?src-supplier=Verical; ComponentLink5Description: https://datasheet.ciiva.com/15189/getdatasheetpartid-323748-15189466.pdf?src-supplier=Verical; ComponentLink6URL: https://datasheet.ciiva.com/16793/pyu-rc0402-51-rohs-l-6-r-16793430.pdf?src-supplier=Future+Electronics; ComponentLink6Description: https://datasheet.ciiva.com/16793/pyu-rc0402-51-rohs-l-6-r-16793430.pdf?src-supplier=Future+Electronics; Supplier Part Number 1: RC0402FR-0747KL; LCSC Part Number: C93943
U3 = MC34063ADR: 1.5-A boost, buck, inverting switching regulator, operation from 0°C to 70°C 8-SOIC 0 to 70; Manufacturer: Texas Instruments; Output Voltage: 40V; Number of Outputs: 1; Output Current: 1.5A; Switching Frequency: 100kHz; Synchronous Rectifier: No; Output Type: Adjustable; Max Output Current: 750mA; Min Input Voltage: 3V; Min Output Voltage: 1.55V; Quiescent Current: 4mA; Topology: Flyback,SEPIC; Supplier 1: Digi-Key; Manufacturer Part Number: MC34063ADR; RoHS: Yes; Category: Power Supply Modules; Stock 1: 17204; Pricing 1: 1=0.78000, 10=0.68400, 25=0.64240, 100=0.52420, 250=0.48688, 500=0.41438, 1000=0.34206 (USD); Case/Package: D; Number of Pins: 8; Weight: 0.002561oz; Contact Plating: Gold; Min Operating Temperature: 0°C; Max Operating Temperature: 70°C; Packaging: Tape and Reel; Package Quantity: 1; Max Input Voltage: 40V; Max Output Voltage: 40V; Termination: SMD/SMT; Radiation Hardening: No; RoHS Compliant: Yes; Lead Free: Lead Free; REACH SVHC: No SVHC; ComponentLink1URL: https://datasheet.ciiva.com/7408/1862376-7408060.pdf?src-supplier=Newark; ComponentLink1Description: https://datasheet.ciiva.com/7408/1862376-7408060.pdf?src-supplier=Newark; ComponentLink2URL: https://datasheet.ciiva.com/2025/mc33063a-2025162.pdf?src-supplier=Digi-Key; ComponentLink2Description: https://datasheet.ciiva.com/2025/mc33063a-2025162.pdf?src-supplier=Digi-Key; ComponentLink3URL: https://datasheet.ciiva.com/2025/mc33063a-2025161.pdf?src-supplier=Digi-Key; ComponentLink3Description: https://datasheet.ciiva.com/2025/mc33063a-2025161.pdf?src-supplier=Digi-Key; ComponentLink4URL: https://datasheet.ciiva.com/2025/mc33063a-2025163.pdf?src-supplier=Digi-Key; ComponentLink4Description: https://datasheet.ciiva.com/2025/mc33063a-2025163.pdf?src-supplier=Digi-Key; Supplier Part Number 1: 296-17765-1-ND
U4 = LMS8117AMP-3.3/NOPB: IC REG LINEAR 3.3V 1A SOT223; Manufacturer: Texas Instruments; Number of Outputs: 1; Min Input Voltage: 2.5V; Max Input Voltage: 15V; Polarity: Positive; Quiescent Current: 10mA; Accuracy: 1%; Output Type: Fixed; Dropout Voltage: 1.2V; Nominal Supply Current: 5mA; Supplier 1: Arrow Electronics; Manufacturer Part Number: LMS8117AMP-3.3/NOPB; RoHS: Yes; Category: Voltage Regulators - Linear; Stock 1: 843; Pricing 1: 1=1.18760, 10=1.01800, 100=0.77540, 250=0.68460, 500=0.64870, 1000=0.59270 (USD); Mount: Surface Mount; Case/Package: SOT-223; Number of Pins: 4; Contact Plating: Tin,Matte; Min Operating Temperature: 0°C; Max Operating Temperature: 125°C; Output Voltage: 3.3V; Max Output Current: 1A; Packaging: Tape and Reel; Output Current: 1A; Nominal Output Voltage: 3.3V; Output Voltage Accuracy: 1%; Current Rating: 1A; Package Quantity: 1000; Length: 6.5mm; Width: 3.56mm; Height: 1.6mm; Radiation Hardening: No; REACH SVHC: No SVHC; Lead Free: Lead Free; RoHS Compliant: Yes; ComponentLink1URL: https://datasheet.ciiva.com/3225/lms8117a-3225472.pdf?src-supplier=Avnet; ComponentLink1Description: https://datasheet.ciiva.com/3225/lms8117a-3225472.pdf?src-supplier=Avnet; ComponentLink2URL: https://datasheet.ciiva.com/2066/lms8117a-2066594.pdf?src-supplier=Digi-Key; ComponentLink2Description: https://datasheet.ciiva.com/2066/lms8117a-2066594.pdf?src-supplier=Digi-Key; ComponentLink3URL: https://datasheet.ciiva.com/2066/lms8117a-2066595.pdf?src-supplier=Digi-Key; ComponentLink3Description: https://datasheet.ciiva.com/2066/lms8117a-2066595.pdf?src-supplier=Digi-Key; ComponentLink4URL: https://datasheet.ciiva.com/2066/lms8117a-2066596.pdf?src-supplier=Digi-Key; ComponentLink4Description: https://datasheet.ciiva.com/2066/lms8117a-2066596.pdf?src-supplier=Digi-Key; ComponentLink5URL: https://datasheet.ciiva.com/3223/lms8117a-3223813.pdf?src-supplier=Avnet; ComponentLink5Description: https://datasheet.ciiva.com/3223/lms8117a-3223813.pdf?src-supplier=Avnet; ComponentLink6URL: https://datasheet.ciiva.com/25979/lms8117a-25979141.pdf?src-supplier=Avnet+Europe; ComponentLink6Description: https://datasheet.ciiva.com/25979/lms8117a-25979141.pdf?src-supplier=Avnet+Europe; ComponentLink7URL: https://datasheet.ciiva.com/46386/1558097-46386039.pdf?src-supplier=Element14; ComponentLink7Description: https://datasheet.ciiva.com/46386/1558097-46386039.pdf?src-supplier=Element14; ComponentLink8URL: https://datasheet.ciiva.com/8042/90386-8042363.pdf?src-supplier=Element14; ComponentLink8Description: https://datasheet.ciiva.com/8042/90386-8042363.pdf?src-supplier=Element14; ComponentLink9URL: https://datasheet.ciiva.com/5697/1558097-5697692.pdf?src-supplier=Farnell; ComponentLink9Description: https://datasheet.ciiva.com/5697/1558097-5697692.pdf?src-supplier=Farnell; Supplier Part Number 1: LMS8117AMP-3.3/NOPB
U20 = MIC29302WU-TR: IC REG LDO ADJ 3A TO263-5; Manufacturer: Microchip; Output Voltage: 26V; Dropout Voltage: 370mV; Number of Regulators: 1; Min Input Voltage: 2.5V; Min Output Voltage: 1.25V; Max Output Voltage: 25V; Output Type: Adjustable; Output Configuration: Positive; Input Bias Current: 40nA; Reference Voltage: 1.24V; Quiescent Current: 35mA; Accuracy: 1%; Supplier 1: Future Electronics; Manufacturer Part Number: MIC29302WU-TR; RoHS: Yes; Category: Voltage Regulators - Linear; Pricing 1: 750=2.12000, 1500=2.09000, 2250=2.07000, 3000=2.06000, 3750=2.02000 (USD); Mount: Surface Mount; Case/Package: TO-263; Number of Pins: 5; Min Operating Temperature: -40°C; Max Operating Temperature: 125°C; Packaging: Tape and Reel; Package Quantity: 750; Series: -; Output Current: 3A; Max Input Voltage: 26V; Polarity: Positive; Number of Outputs: 1; Max Output Current: 3A; Length: 10.67mm; Width: 9.17mm; Height: 4.59mm; Radiation Hardening: No; Reach SVHC Compliant: Yes; RoHS Compliant: Yes; Lead Free: Lead Free; ComponentLink1URL: https://datasheet.ciiva.com/23772/1572633-23772885.pdf?src-supplier=Newark; ComponentLink1Description: https://datasheet.ciiva.com/23772/1572633-23772885.pdf?src-supplier=Newark; ComponentLink2URL: https://datasheet.ciiva.com/16296/mic29150-16296190.pdf?src-supplier=Future+Electronics; ComponentLink2Description: https://datasheet.ciiva.com/16296/mic29150-16296190.pdf?src-supplier=Future+Electronics; ComponentLink3URL: https://datasheet.ciiva.com/15200/getdatasheetpartid-143209-15200663.pdf?src-supplier=Verical; ComponentLink3Description: https://datasheet.ciiva.com/15200/getdatasheetpartid-143209-15200663.pdf?src-supplier=Verical; Supplier Part Number 1: 3153683; LCSC Part Number: C11149; Item Type: IC